# Altium project SPSU.PrjPcb
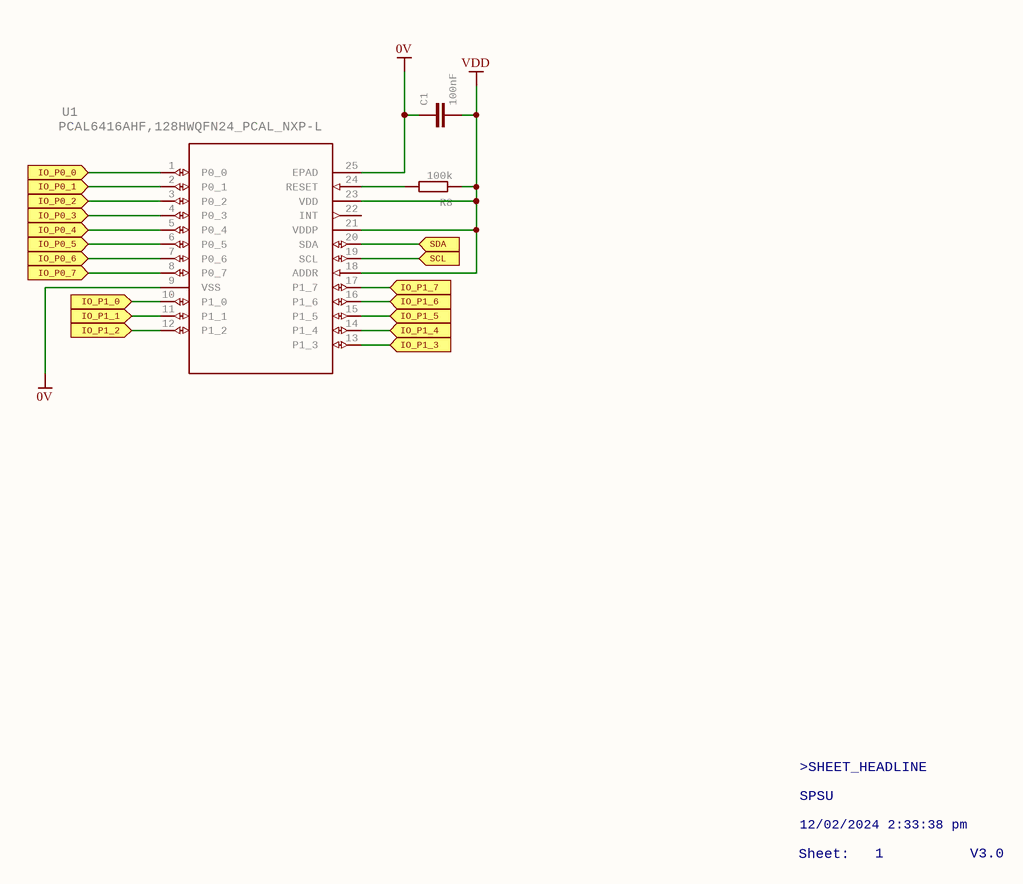
[diagram p0: SPSU_0.SchDoc]
6 sheets, 44 parts. Net scope: flat (ports and power ports of the same name join across sheets).
Board file: SPSU.PcbDoc
Sheets:
  SPSU_0.SchDoc
  SPSU_1.SchDoc
  SPSU_2.SchDoc
  SPSU_3.SchDoc
  SPSU_4.SchDoc
  SPSU_5.SchDoc

## Sheet SPSU_0.SchDoc: SPSU
size 292 x 208 mm; PCB_VERSION: V3.0; Origin: Eagle; Date: 12/02/2024 2:33:38 pm; SheetNumber: 1; SCHEMATIC_VERSION: V3.0; GateName_1: G$1; SymbolName_1: A4L-LOC; LibraryName: frames_corvus; DeviceSetName: A4L-LOC; Sheet: Sheet:

### Parts
C1  100nF  [C0603]
R8  100k  [R0603]
U1  PCAL6416AHF,128HWQFN24_PCAL_NXP-L  [HWQFN24_PCAL_NXP-L]

### Ports
IO_P0_0 (in), IO_P0_1 (in), IO_P0_2 (in), IO_P0_3 (in), IO_P0_4 (in), IO_P0_5 (in), IO_P0_6 (in), IO_P0_7 (in), IO_P1_0 (in), IO_P1_1 (in), IO_P1_2 (in), IO_P1_3 (in), IO_P1_4 (in), IO_P1_5 (in), IO_P1_6 (in), IO_P1_7 (in), SCL (in), SDA (in)

### Nets
0V: C1.1 U1.9(VSS) U1.25(EPAD)
VDD: C1.2 R8.1 U1.18(ADDR) U1.21(VDDP) U1.23(VDD)
NetR3_2: U1.12(P1_2) ; port IO_P1_2
NetR5_1: U1.2(P0_1) ; port IO_P0_1
NetR6_2: U1.3(P0_2) ; port IO_P0_2
NetR8_2: R8.2 U1.24(RESET)
NetR10_2: U1.4(P0_3) ; port IO_P0_3
NetR11_2: U1.5(P0_4) ; port IO_P0_4
NetR12_2: U1.6(P0_5) ; port IO_P0_5
NetR13_2: U1.7(P0_6) ; port IO_P0_6
NetSCL1_1: U1.19(SCL) ; port SCL
NetSDA1_1: U1.20(SDA) ; port SDA
NetU1_1: U1.1(P0_0) ; port IO_P0_0
NetU1_8: U1.8(P0_7) ; port IO_P0_7
NetU1_10: U1.10(P1_0) ; port IO_P1_0
NetU1_11: U1.11(P1_1) ; port IO_P1_1
NetU1_13: U1.13(P1_3) ; port IO_P1_3
NetU1_14: U1.14(P1_4) ; port IO_P1_4
NetU1_15: U1.15(P1_5) ; port IO_P1_5
NetU1_16: U1.16(P1_6) ; port IO_P1_6
NetU1_17: U1.17(P1_7) ; port IO_P1_7

Not connected (* = marked no-connect by the designer): U1 22(INT)

### Notes on the sheet
- SPSU
- >SHEET_HEADLINE
- Sheet:
- 12/02/2024 2:33:38 pm
- 1
- V3.0

### Library data of the parts
C1 = C_0603: GateName_1: G$1; SymbolName_1: C-EU; LibraryName: corvus_RC; DeviceSetName: C_0603; FARNELL: 2320813
R8 = R_0603: GateName_1: >R_NAME$1; SymbolName_1: R-EU; LibraryName: corvus_RC; DeviceSetName: R_0603; FARNELL: 2447226
U1 = PCAL6416AHF,128HWQFN24_PCAL_NXP-L: MFR_NAME: NXP; GateName_1: A; SymbolName_1: PCAL6416AHF,128; DeviceName: HWQFN24_PCAL_NXP-L; LibraryName: PCAL6416AHF; DeviceSetName: PCAL6416AHF,128; COPYRIGHT: Copyright (C) 2022 Ultra Librarian. All rights reserved.; MANUFACTURER_PART_NUMBER: PCAL6416AHF,128

## Sheet SPSU_1.SchDoc: SPSU
size 292 x 217 mm; PCB_VERSION: V3.0; Origin: Eagle; Date: 12/02/2024 2:33:38 pm; SheetNumber: 2; SCHEMATIC_VERSION: SCHEMATIC_VERSION; GateName_1: G$1; SymbolName_1: A4L-LOC; LibraryName: frames_corvus; DeviceSetName: A4L-LOC; Sheet: Sheet:
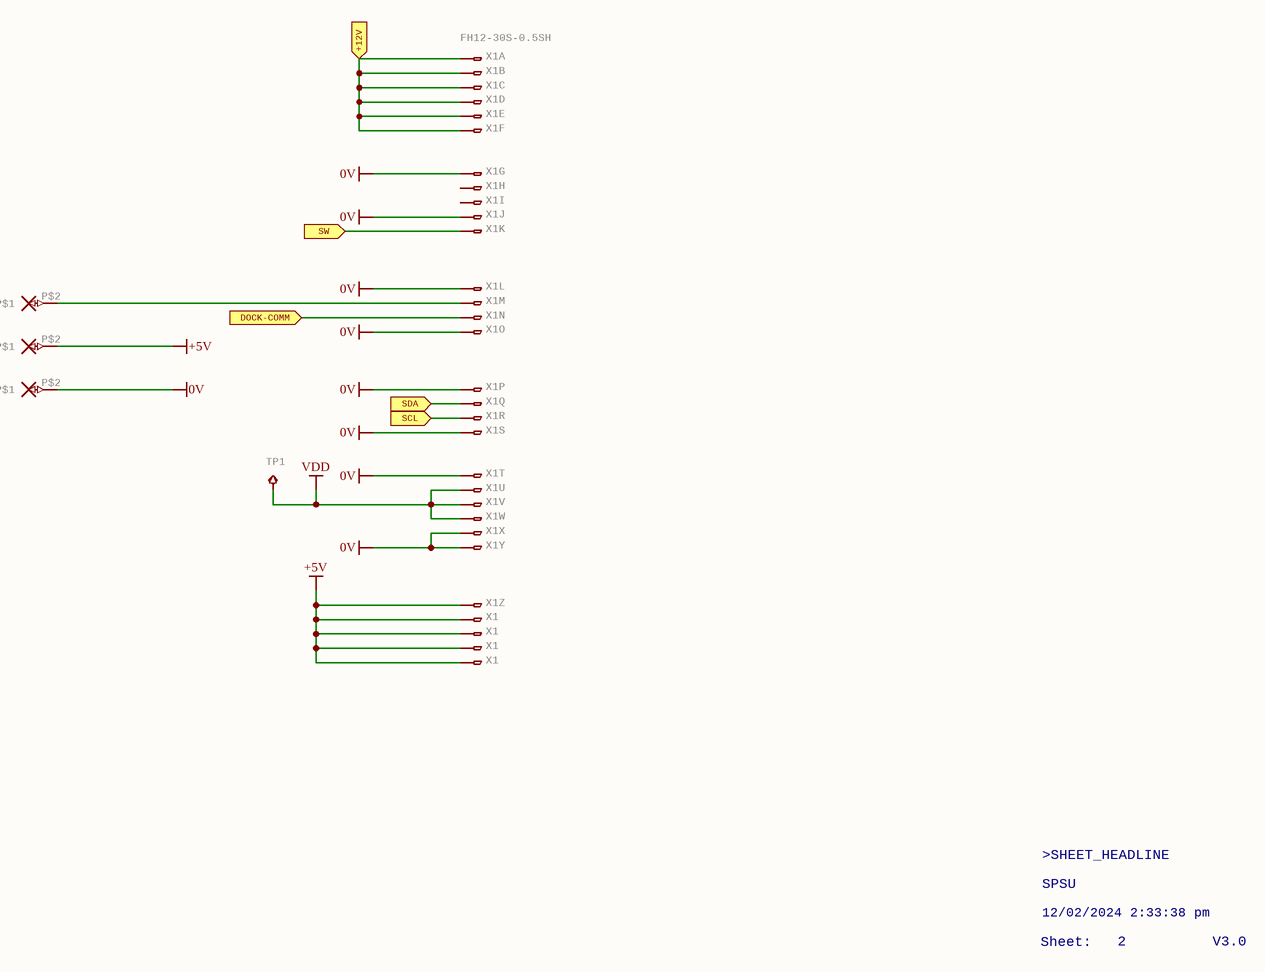
[diagram p1: SPSU_1.SchDoc]

### Parts
+  TH-0.75/0.6  [TH-0.75/0.6]  (value not drawn)
-  TH-0.75/0.6  [TH-0.75/0.6]  (value not drawn)
D  TH-0.75/0.6  [TH-0.75/0.6]  (value not drawn)
TP1  TPTP11R  [TP11R]  (value not drawn)
X1  FH12-30S-0.5SH  [FH12-30S-0.5SH]  (parts A,B,C,D,E,F,G,H,I,J,K,L,M,N,O,P,Q,R,S,T,U,V,W,X,Y,Z,27,28,29,30 of 30)

### Ports
+12V (in), DOCK-COMM (in), SCL (in), SDA (in), SW (in)

### Nets
0V: -.P$2(P$1) X1.7 X1.10 X1.12 X1.15 X1.16 X1.19 X1.20 X1.24 X1.25
+5V: +.P$2(P$1) X1.26 X1.27 X1.28 X1.29 X1.30
VDD: TP1.TP X1.21 X1.22 X1.23
NetCHG+_P$1: X1.1 X1.2 X1.3 X1.4 X1.5 X1.6 ; port +12V
NetD_P$2: D.P$2(P$1) X1.13
NetS1_2: X1.11 ; port SW
NetSCL1_1: X1.18 ; port SCL
NetSDA1_1: X1.17 ; port SDA
NetU$2_P$1: X1.14 ; port DOCK-COMM

Not connected (* = marked no-connect by the designer): X1 8(1) 9(1)

### Notes on the sheet
- >SHEET_HEADLINE
- Sheet:
- SPSU
- 12/02/2024 2:33:38 pm
- 2
- V3.0

### Library data of the parts
+ - D = TH-0.75/0.6: GateName_1: G$1; SymbolName_1: TH; LibraryName: corvus_holes; DeviceSetName: TH-0.75/0.6
TP1 = TPTP11R: GateName_1: G$1; SymbolName_1: TP; DeviceName: TP11R; LibraryName: corvus_holes; DeviceSetName: TP
X1 = FH12-30S-0.5SH: GateName_1: -1; SymbolName_1: PINV; GateName_2: -2; SymbolName_2: PIN; GateName_3: -3; GateName_4: -4; GateName_5: -5; GateName_6: -6; GateName_7: -7; GateName_8: -8; GateName_9: -9; GateName_10: -10; GateName_11: -11; GateName_12: -12; GateName_13: -13; GateName_14: -14; GateName_15: -15; GateName_16: -16; GateName_17: -17; GateName_18: -18; GateName_19: -19; GateName_20: -20; GateName_21: -21; GateName_22: -22; GateName_23: -23; GateName_24: -24; GateName_25: -25; GateName_26: -26; GateName_27: -27; GateName_28: -28; GateName_29: -29; GateName_30: -30; DeviceName: H; SymbolName_3: PIN; SymbolName_4: PIN; SymbolName_5: PIN; SymbolName_6: PIN; SymbolName_7: PIN; SymbolName_8: PIN; SymbolName_9: PIN; SymbolName_10: PIN; SymbolName_11: PIN; SymbolName_12: PIN; SymbolName_13: PIN; SymbolName_14: PIN; SymbolName_15: PIN; SymbolName_16: PIN; SymbolName_17: PIN; SymbolName_18: PIN; SymbolName_19: PIN; SymbolName_20: PIN; SymbolName_21: PIN; SymbolName_22: PIN; SymbolName_23: PIN; SymbolName_24: PIN; SymbolName_25: PIN; SymbolName_26: PIN; SymbolName_27: PIN; SymbolName_28: PIN; SymbolName_29: PIN; SymbolName_30: PIN; LibraryName: corvus_parts; DeviceSetName: FH12-30S-0.5S; FARNELL: 1324555

## Sheet SPSU_2.SchDoc: SPSU
size 292 x 217 mm; PCB_VERSION: V3.0; Origin: Eagle; Date: 12/02/2024 2:33:38 pm; SheetNumber: 3; SCHEMATIC_VERSION: SCHEMATIC_VERSION; GateName_1: G$1; SymbolName_1: A4L-LOC; LibraryName: frames_corvus; DeviceSetName: A4L-LOC; Sheet: Sheet:
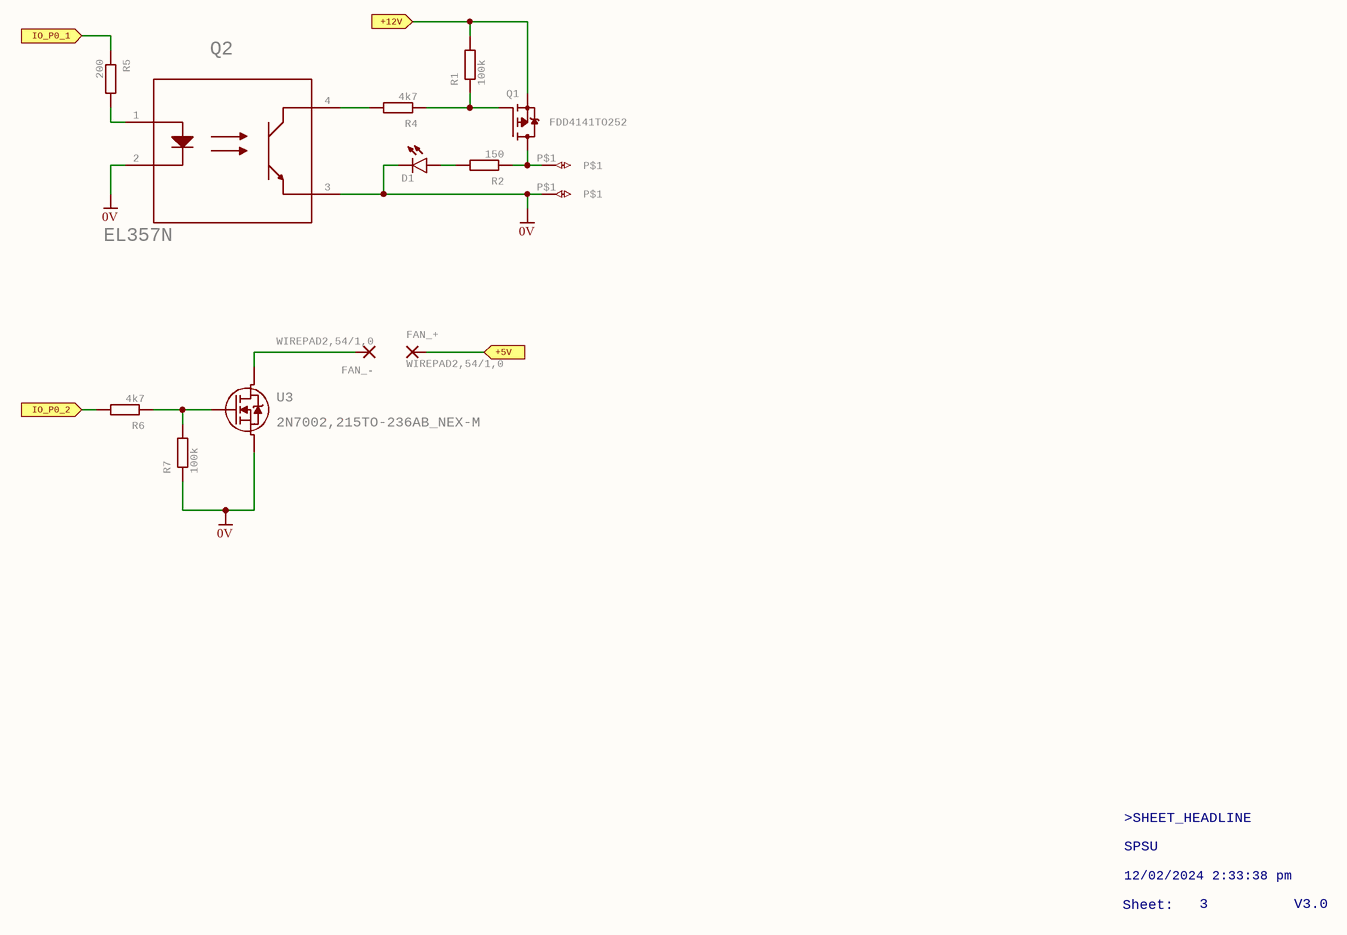
[diagram p2: SPSU_2.SchDoc]

### Parts
D1  LEDCHIPLED_0805  [CHIPLED_0805]  (value not drawn)
ESC+  ESC  [ESC]  (value not drawn)
ESC-  ESC  [ESC]  (value not drawn)
FAN_+  WIREPAD2,54/1,0  [2,54/1,0]
FAN_-  WIREPAD2,54/1,0  [2,54/1,0]
Q1  FDD4141TO252  [TO252]
Q2  EL357N  [EL357N(C)(TA)-VG_EVE-L]
R1  100k  [R0603]
R2  150  [R0603]
R4  4k7  [R0603]
R5  200  [R0603]
R6  4k7  [R0603]
R7  100k  [R0603]
U3  2N7002,215TO-236AB_NEX-M  [TO-236AB_NEX-M]

### Ports
+5V (in), +12V (in), IO_P0_1 (in), IO_P0_2 (in)

### Nets
0V: D1.C ESC-.P$1 Q2.2 Q2.3 R7.1 U3.2
NetCHG+_P$1: Q1.2(S) R1.2 ; port +12V
NetD1_A: D1.A R2.2
NetESC+_P$1: ESC+.P$1 Q1.3(D) R2.1
NetFAN_+_1: FAN_+.1(P) ; port +5V
NetFAN_-_1: FAN_-.1(P) U3.3
NetQ1_1: Q1.1(G) R1.1 R4.1
NetQ2_1: Q2.1 R5.2
NetQ2_4: Q2.4 R4.2
NetR5_1: R5.1 ; port IO_P0_1
NetR6_1: R6.1 R7.2 U3.1
NetR6_2: R6.2 ; port IO_P0_2

### Notes on the sheet
- >SHEET_HEADLINE
- Sheet:
- SPSU
- 12/02/2024 2:33:38 pm
- 3
- V3.0

### Library data of the parts
D1 = LEDCHIPLED_0805: LED   OSRAM: - CHIPLED LG R971, LG N971, LY N971, LG Q971, LY Q971, LO R971, LY R971 LH N974, LH R974 LS Q976, LO Q976, LY Q976 LO Q996 - Hyper CHIPLED LW Q18S LB Q993, LB Q99A, LB R99A - SideLED LS A670, LO A670, LY A670, LG A670, LP A670 LB A673, LV A673, LT A673, LW A673 LH A674 LY A675 LS A676, LA A676, LO A676, LY A676, LW A676 LS A679, LY A679, LG A679 -  Hyper Micro SIDELEDÂ® LS Y876, LA Y876, LO Y876, LY Y876 LT Y87S - SmartLED LW L88C, LW L88S LB L89C, LB L89S, LG L890 LS L89K, LO L89K, LY L89K LS L896, LA L896, LO L896, LY L896 - TOPLED LS T670, LO T670, LY T670, LG T670, LP T670 LSG T670, LSP T670, LSY T670, LOP T670, LYG T670 LG T671, LOG T671, LSG T671 LB T673, LV T673, LT T673, LW T673 LH T674 LS T676, LA T676, LO T676, LY T676, LB T676, LH T676, LSB T676, LW T676 LB T67C, LV T67C, LT T67C, LS T67K, LO T67K, LY T67K, LW E67C LS E67B, LA E67B, LO E67B, LY E67B, LB E67C, LV E67C, LT E67C LW T67C LS T679, LY T679, LG T679 LS T770, LO T770, LY T770, LG T770, LP T770 LB T773, LV T773, LT T773, LW T773 LH T774 LS E675, LA E675, LY E675, LS T675 LS T776, LA T776, LO T776, LY T776, LB T776 LHGB T686 LT T68C, LB T68C - Hyper Mini TOPLEDÂ® LB M676 - Mini TOPLED SantanaÂ® LG M470 LS M47K, LO M47K, LY M47K    Source: http://www.osram.convergy.de   LUXEON: - LUMILEDÂ® LXK2-PW12-R00, LXK2-PW12-S00, LXK2-PW14-U00, LXK2-PW14-V00 LXK2-PM12-R00, LXK2-PM12-S00, LXK2-PM14-U00 LXK2-PE12-Q00, LXK2-PE12-R00, LXK2-PE12-S00, LXK2-PE14-T00, LXK2-PE14-U00 LXK2-PB12-K00, LXK2-PB12-L00, LXK2-PB12-M00, LXK2-PB14-N00, LXK2-PB14-P00, LXK2-PB14-Q00 LXK2-PR12-L00, LXK2-PR12-M00, LXK2-PR14-Q00, LXK2-PR14-R00 LXK2-PD12-Q00, LXK2-PD12-R00, LXK2-PD12-S00 LXK2-PH12-R00, LXK2-PH12-S00 LXK2-PL12-P00, LXK2-PL12-Q00, LXK2-PL12-R00    Source: www.luxeon.com   KINGBRIGHT:   KA-3528ASYC Source: www.kingbright.com; GateName_1: G$1; POPULARITY: 52; SymbolName_1: LED; DeviceName: CHIPLED_0805; LibraryName: led_CUSTOM; DeviceSetName: LED
ESC+ ESC- = ESC: GateName_1: G$1; SymbolName_1: ESC; LibraryName: corvus; DeviceSetName: ESC
FAN_+ FAN_- = WIREPAD2,54/1,0: Wire PAD connect wire on PCB; GateName_1: G$1; POPULARITY: 4; SymbolName_1: PAD; DeviceName: 2,54/1,0; LibraryName: wirepad; DeviceSetName: WIREPAD
Q1 = FDD4141TO252: P-Channel PowerTrenchÂ® MOSFET   Source:  FDD4141.pdf; GateName_1: G$1; SymbolName_1: P-MOSFET; POPULARITY: 3; DeviceName: TO252; LibraryName: transistor-fet; DeviceSetName: FDD4141
Q2 = EL357N(C)(TA)-VGEL357N(C)(TA)-VG_EVE-L: MFR_NAME: Everlight; GateName_1: A; SymbolName_1: OPTOCOUPLER_1A_2C_3E_4C; DeviceName: EL357N(C)(TA)-VG_EVE-L; LibraryName: EL357N; DeviceSetName: EL357N(C)(TA)-VG; COPYRIGHT: Copyright (C) 2022 Ultra Librarian. All rights reserved.; DIGI-KEY_PART_NUMBER_1: 1080-1601-2-ND; DIGI-KEY_PART_NUMBER_2: 1080-1601-1-ND; DIGI-KEY_PART_NUMBER_3: 1080-1601-6-ND; MANUFACTURER_PART_NUMBER: EL357N(C)(TA)-VG
R1 R4 R6 R7 = R_0603: as R8 on sheet SPSU_0; LibraryName: corvus_RC; DeviceSetName: R_0603
  R1 R7: FARNELL: 2447226
  R4 R6: FARNELL: 2447385
R2 R5 = R-EU_R0603: RESISTOR, European symbol; GateName_1: G$1; SymbolName_1: R-EU; DeviceSetName: R-EU_; POPULARITY: 70; DeviceName: R0603; LibraryName: rcl_CUSTOM; SPICEPREFIX: R
U3 = 2N7002,215TO-236AB_NEX-M: MFR_NAME: Nexperia; GateName_1: A; SymbolName_1: TRANS_S; DeviceName: TO-236AB_NEX-M; LibraryName: 2n7002; DeviceSetName: 2N7002,215; COPYRIGHT: Copyright (C) 2022 Ultra Librarian. All rights reserved.; MANUFACTURER_PART_NUMBER: 2N7002,215

## Sheet SPSU_3.SchDoc: SPSU
size 292 x 217 mm; PCB_VERSION: V3.0; Origin: Eagle; Date: 12/02/2024 2:33:38 pm; SheetNumber: 4; SCHEMATIC_VERSION: SCHEMATIC_VERSION; GateName_1: G$1; SymbolName_1: A4L-LOC; LibraryName: frames_corvus; DeviceSetName: A4L-LOC; Sheet: Sheet:
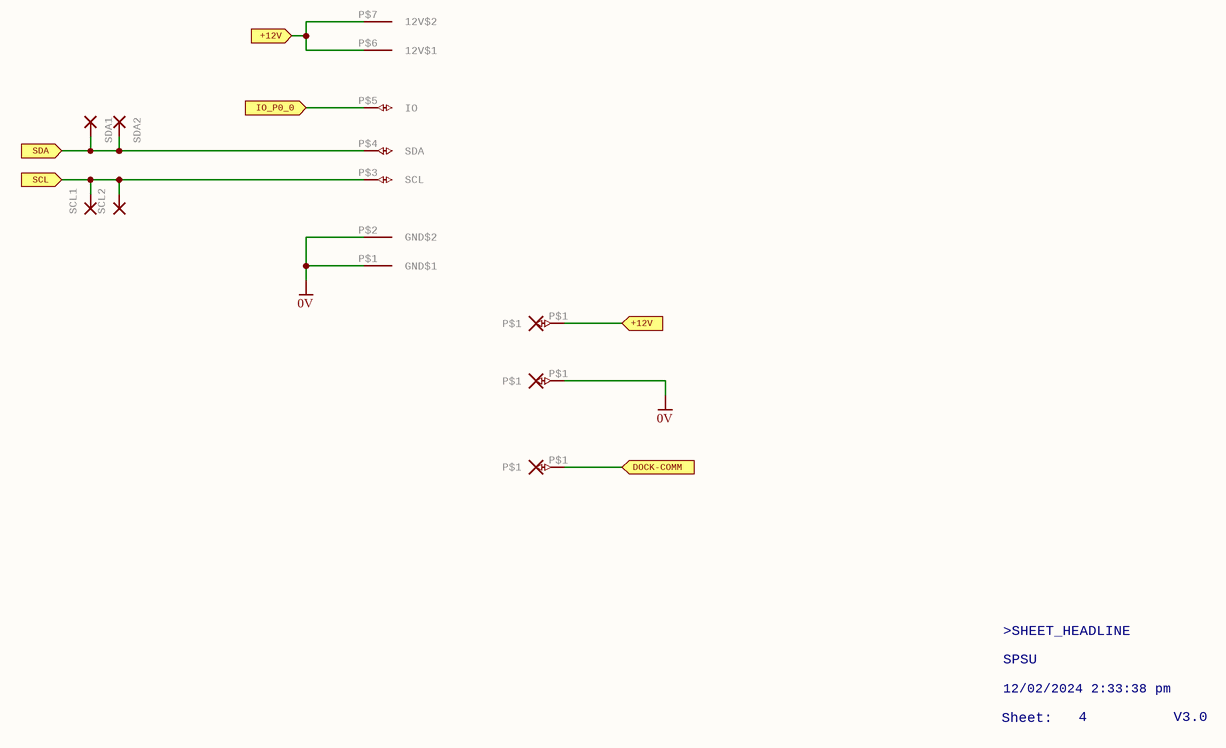
[diagram p3: SPSU_3.SchDoc]

### Parts
CHG+  SMT-PAD_SQ6MM  [SMT-PAD_SQ6MM]  (value not drawn)
CHG-  SMT-PAD_SQ6MM  [SMT-PAD_SQ6MM]  (value not drawn)
SCL1  1,6/0,8  [1,6/0,8]  (value not drawn)
SCL2  1,6/0,8  [1,6/0,8]  (value not drawn)
SDA1  1,6/0,8  [1,6/0,8]  (value not drawn)
SDA2  1,6/0,8  [1,6/0,8]  (value not drawn)
U$1  BATT_CON_THT  [BATT_CON_THT]  (value not drawn)
U$2  SMT-PAD_R3MM  [SMT-PAD_R3MM]  (value not drawn)

### Ports
+12V (in), DOCK-COMM (in), IO_P0_0 (in), SCL (in), SDA (in)

### Nets
0V: CHG-.P$1 U$1.P$1(GND$1) U$1.P$2(GND$2)
NetCHG+_P$1: CHG+.P$1 U$1.P$6(12V$1) U$1.P$7(12V$2) ; port +12V
NetSCL1_1: SCL1.1(P) SCL2.1(P) U$1.P$3(SCL) ; port SCL
NetSDA1_1: SDA1.1(P) SDA2.1(P) U$1.P$4(SDA) ; port SDA
NetU1_1: U$1.P$5(IO) ; port IO_P0_0
NetU$2_P$1: U$2.P$1 ; port DOCK-COMM

### Notes on the sheet
- >SHEET_HEADLINE
- Sheet:
- SPSU
- 12/02/2024 2:33:38 pm
- 4
- V3.0

### Library data of the parts
CHG+ CHG- = SMT-PAD_SQ6MM: GateName_1: G$1; SymbolName_1: TH; LibraryName: corvus_holes; DeviceSetName: SMT-PAD_SQ6MM
SCL1 SCL2 SDA1 SDA2 = 1,6/0,8: THROUGH-HOLE PAD; GateName_1: P; POPULARITY: 15; SymbolName_1: PAD; LibraryName: wirepad; DeviceSetName: 1,6/0,8
U$1 = BATT_CON_THT: GateName_1: G$1; SymbolName_1: BATT_CON; LibraryName: corvus_parts; DeviceSetName: BATT_CON_THT
U$2 = SMT-PAD_R3MM: GateName_1: G$1; SymbolName_1: TH; LibraryName: corvus_holes; DeviceSetName: SMT-PAD_R3MM

## Sheet SPSU_4.SchDoc: SPSU
size 292 x 217 mm; PCB_VERSION: V3.0; Origin: Eagle; Date: 12/02/2024 2:33:38 pm; SheetNumber: 5; SCHEMATIC_VERSION: SCHEMATIC_VERSION; GateName_1: G$1; SymbolName_1: A4L-LOC; LibraryName: frames_corvus; DeviceSetName: A4L-LOC; Sheet: Sheet:
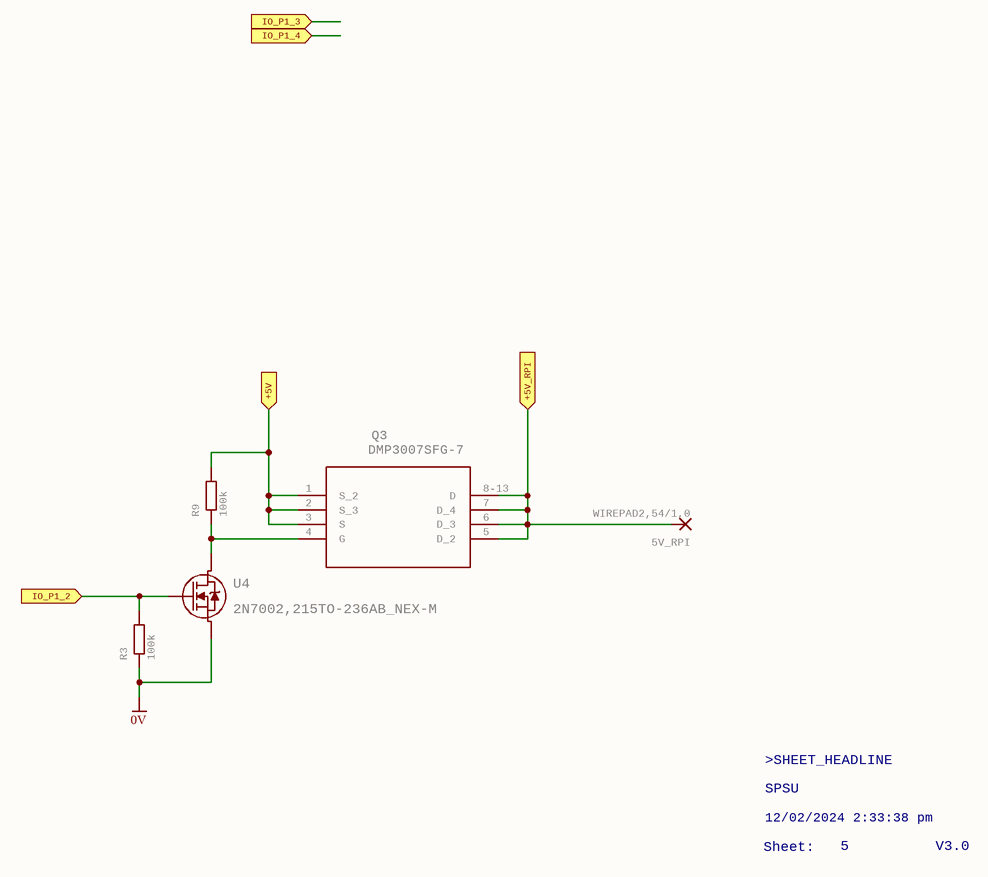
[diagram p4: SPSU_4.SchDoc]

### Parts
5V_RPI  WIREPAD2,54/1,0  [2,54/1,0]
Q3  DMP3007SFG-7  [POWERDI3333-8_3P3X3P3_DIO]
R3  100k  [R0603]
R9  100k  [R0603]
U4  2N7002,215TO-236AB_NEX-M  [TO-236AB_NEX-M]

### Ports
+5V (in), +5V_RPI (in), IO_P1_2 (in), IO_P1_3 (in), IO_P1_4 (in)

### Nets
0V: R3.1 U4.2
Net5V_RPI_1: 5V_RPI.1(P) Q3.5(D_2) Q3.6(D_3) Q3.7(D_4) Q3.8-13(D) ; port +5V_RPI
NetFAN_+_1: Q3.1(S_2) Q3.2(S_3) Q3.3(S) R9.2 ; port +5V
NetQ3_4: Q3.4(G) R9.1 U4.3
NetR3_2: R3.2 U4.1 ; port IO_P1_2

### Notes on the sheet
- >SHEET_HEADLINE
- Sheet:
- SPSU
- 12/02/2024 2:33:38 pm
- 5
- V3.0

### Library data of the parts
5V_RPI = WIREPAD2,54/1,0: as FAN_+ on sheet SPSU_2; SymbolName_1: PAD; DeviceName: 2,54/1,0; LibraryName: wirepad; DeviceSetName: WIREPAD
Q3 = DMP3007SFG-7: MFR_NAME: Diodes Inc; GateName_1: A; SymbolName_1: DMP3007SFG-7; LibraryName: Mosfets; DeviceSetName: DMP3007SFG-7; COPYRIGHT: Copyright (C) 2022 Ultra Librarian. All rights reserved.; MANUFACTURER_PART_NUMBER: DMP3007SFG-7
R3 R9 = R_0603: as R8 on sheet SPSU_0; LibraryName: corvus_RC; DeviceSetName: R_0603; FARNELL: 2447226
U4 = 2N7002,215TO-236AB_NEX-M: as U3 on sheet SPSU_2; DeviceName: TO-236AB_NEX-M; LibraryName: 2n7002; DeviceSetName: 2N7002,215; COPYRIGHT: Copyright (C) 2022 Ultra Librarian. All rights reserved.; MANUFACTURER_PART_NUMBER: 2N7002,215

## Sheet SPSU_5.SchDoc: SPSU
size 292 x 217 mm; PCB_VERSION: V3.0; Origin: Eagle; Date: 12/02/2024 2:33:38 pm; SheetNumber: 6; SCHEMATIC_VERSION: SCHEMATIC_VERSION; GateName_1: G$1; SymbolName_1: A4L-LOC; LibraryName: frames_corvus; DeviceSetName: A4L-LOC; Sheet: Sheet:
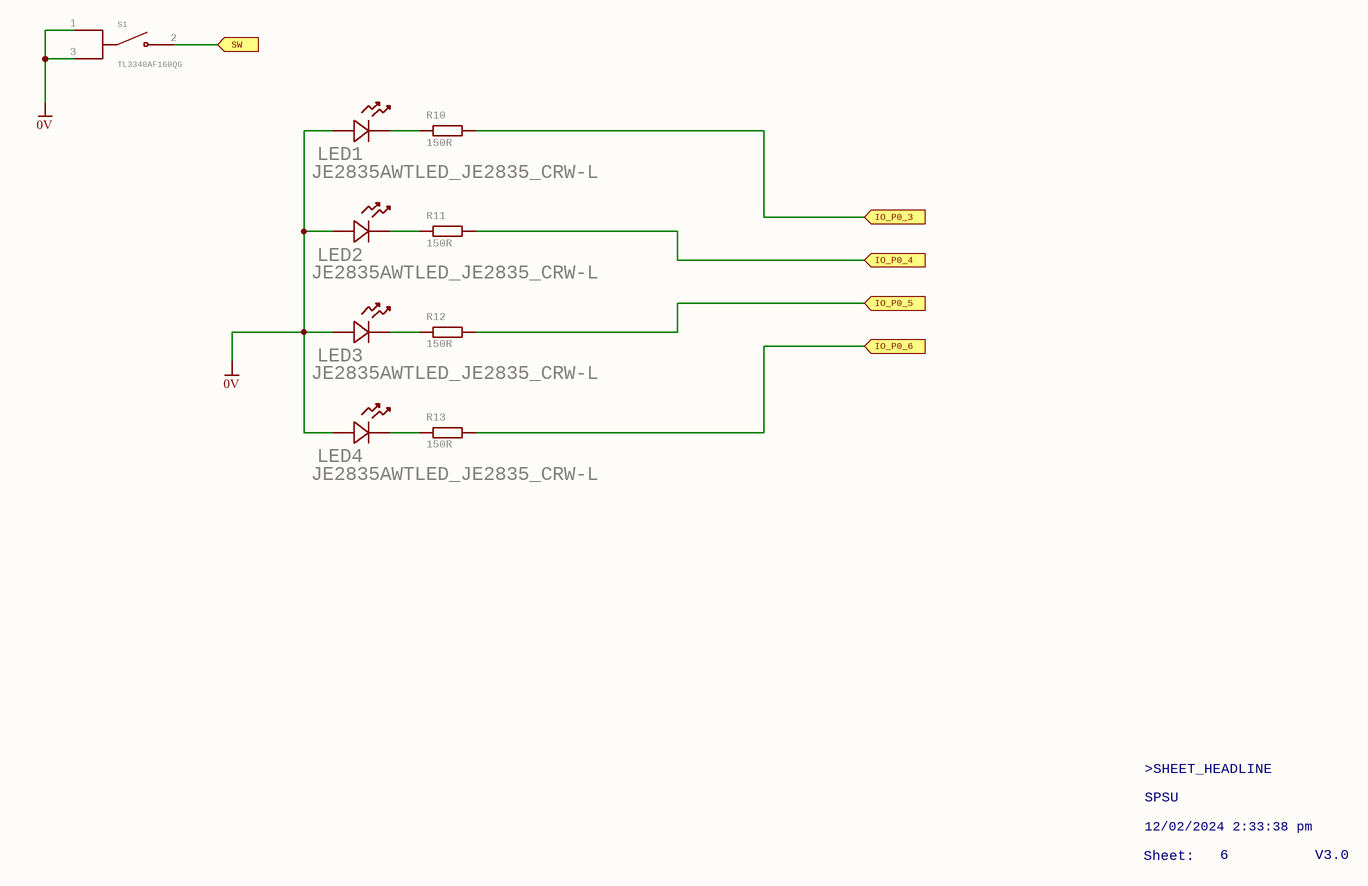
[diagram p5: SPSU_5.SchDoc]

### Parts
LED1  JE2835AWTLED_JE2835_CRW-L  [LED_JE2835_CRW-L]
LED2  JE2835AWTLED_JE2835_CRW-L  [LED_JE2835_CRW-L]
LED3  JE2835AWTLED_JE2835_CRW-L  [LED_JE2835_CRW-L]
LED4  JE2835AWTLED_JE2835_CRW-L  [LED_JE2835_CRW-L]
R10  150R  [R0603]
R11  150R  [R0603]
R12  150R  [R0603]
R13  150R  [R0603]
S1  TL3340AF160QG  [SW_TL3340AF160QG]

### Ports
IO_P0_3 (in), IO_P0_4 (in), IO_P0_5 (in), IO_P0_6 (in), SW (in)

### Nets
0V: LED1.1 LED2.1 LED3.1 LED4.1 S1.1(COM_1) S1.3(COM_2)
NetLED1_2: LED1.2 R10.1
NetLED2_2: LED2.2 R11.1
NetLED3_2: LED3.2 R12.1
NetLED4_2: LED4.2 R13.1
NetR10_2: R10.2 ; port IO_P0_3
NetR11_2: R11.2 ; port IO_P0_4
NetR12_2: R12.2 ; port IO_P0_5
NetR13_2: R13.2 ; port IO_P0_6
NetS1_2: S1.2(NO) ; port SW

### Notes on the sheet
- >SHEET_HEADLINE
- Sheet:
- SPSU
- 12/02/2024 2:33:38 pm
- 6
- V3.0

### Library data of the parts
LED1-LED4 = JE2835AWTLED_JE2835_CRW-L: MANUFACTURER_PART_NUMBER: JE2835AWT-00-0000-000A0UF830E; MFR_NAME: Wolfspeed; GateName_1: A; SymbolName_1: LED; DeviceName: LED_JE2835_CRW-L; LibraryName: HBLED; DeviceSetName: JE2835AWT; COPYRIGHT: Copyright (C) 2022 Ultra Librarian. All rights reserved.
R10-R13 = R_0603: as R8 on sheet SPSU_0; LibraryName: corvus_RC; DeviceSetName: R_0603; FARNELL: FARNELL
S1 = TL3340AF160QG: Check availability; GateName_1: G$1; MOUSSER: 612-TL3340AF160QG; SymbolName_1: TL3340AF160QG; LibraryName: corvus_parts; DeviceSetName: TL3340AF160QG; DIGIKEY: EG4627TR-ND; FARNELL: 2787247

## Nets that join several sheets
0V: SPSU_0 (C1.1 U1.9 U1.25), SPSU_1 (10 pins), SPSU_2 (6 pins), SPSU_3 (CHG-.P$1 U$1.P$1 U$1.P$2), SPSU_4 (R3.1 U4.2), SPSU_5 (6 pins)
VDD: SPSU_0 (5 pins), SPSU_1 (TP1.TP X1.21 X1.22 X1.23)
NetCHG+_P$1: SPSU_1 (6 pins), SPSU_2 (Q1.2 R1.2), SPSU_3 (CHG+.P$1 U$1.P$6 U$1.P$7)
NetFAN_+_1: SPSU_2 (FAN_+.1), SPSU_4 (Q3.1 Q3.2 Q3.3 R9.2)
NetR3_2: SPSU_0 (U1.12), SPSU_4 (R3.2 U4.1)
NetR5_1: SPSU_0 (U1.2), SPSU_2 (R5.1)
NetR6_2: SPSU_0 (U1.3), SPSU_2 (R6.2)
NetR10_2: SPSU_0 (U1.4), SPSU_5 (R10.2)
NetR11_2: SPSU_0 (U1.5), SPSU_5 (R11.2)
NetR12_2: SPSU_0 (U1.6), SPSU_5 (R12.2)
NetR13_2: SPSU_0 (U1.7), SPSU_5 (R13.2)
NetS1_2: SPSU_1 (X1.11), SPSU_5 (S1.2)
NetSCL1_1: SPSU_0 (U1.19), SPSU_1 (X1.18), SPSU_3 (SCL1.1 SCL2.1 U$1.P$3)
NetSDA1_1: SPSU_0 (U1.20), SPSU_1 (X1.17), SPSU_3 (SDA1.1 SDA2.1 U$1.P$4)
NetU1_1: SPSU_0 (U1.1), SPSU_3 (U$1.P$5)
NetU$2_P$1: SPSU_1 (X1.14), SPSU_3 (U$2.P$1)